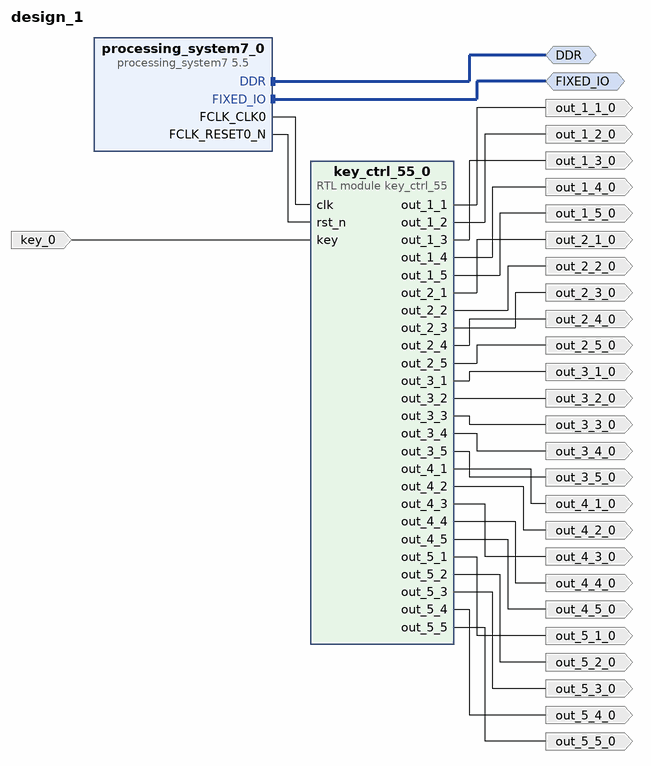
[diagram p0: block diagram of the top level]
# Vivado block design design_1, xc7z035ffg900-2, Vivado 2020.2
create_bd_design design_1

create_bd_intf_port -mode Master -vlnv xilinx.com:interface:ddrx_rtl:1.0 DDR
create_bd_intf_port -mode Master -vlnv xilinx.com:display_processing_system7:fixedio_rtl:1.0 FIXED_IO
create_bd_port -dir I key_0
create_bd_port -dir O out_1_1_0
create_bd_port -dir O out_1_2_0
create_bd_port -dir O out_1_3_0
create_bd_port -dir O out_1_4_0
create_bd_port -dir O out_1_5_0
create_bd_port -dir O out_2_1_0
create_bd_port -dir O out_2_2_0
create_bd_port -dir O out_2_3_0
create_bd_port -dir O out_2_4_0
create_bd_port -dir O out_2_5_0
create_bd_port -dir O out_3_1_0
create_bd_port -dir O out_3_2_0
create_bd_port -dir O out_3_3_0
create_bd_port -dir O out_3_4_0
create_bd_port -dir O out_3_5_0
create_bd_port -dir O out_4_1_0
create_bd_port -dir O out_4_2_0
create_bd_port -dir O out_4_3_0
create_bd_port -dir O out_4_4_0
create_bd_port -dir O out_4_5_0
create_bd_port -dir O out_5_1_0
create_bd_port -dir O out_5_2_0
create_bd_port -dir O out_5_3_0
create_bd_port -dir O out_5_4_0
create_bd_port -dir O out_5_5_0

create_bd_cell -type ip -vlnv xilinx.com:ip:processing_system7:5.5 processing_system7_0
set_property -dict [list \
  CONFIG.PCW_APU_PERIPHERAL_FREQMHZ 666.666666 \
  CONFIG.PCW_CPU_CPU_6X4X_MAX_RANGE 800 \
  CONFIG.PCW_ENET0_ENET0_IO {MIO 16 .. 27} \
  CONFIG.PCW_ENET0_GRP_MDIO_ENABLE 1 \
  CONFIG.PCW_ENET0_GRP_MDIO_IO {MIO 52 .. 53} \
  CONFIG.PCW_ENET0_PERIPHERAL_ENABLE 1 \
  CONFIG.PCW_FPGA0_PERIPHERAL_FREQMHZ 100 \
  CONFIG.PCW_FPGA1_PERIPHERAL_FREQMHZ 50 \
  CONFIG.PCW_GPIO_MIO_GPIO_ENABLE 0 \
  CONFIG.PCW_NAND_NAND_IO {MIO 0 2.. 14} \
  CONFIG.PCW_NAND_PERIPHERAL_ENABLE 1 \
  CONFIG.PCW_PERIPHERAL_BOARD_PRESET None \
  CONFIG.PCW_PRESET_BANK1_VOLTAGE {LVCMOS 1.8V} \
  CONFIG.PCW_SD0_PERIPHERAL_ENABLE 0 \
  CONFIG.PCW_UART0_PERIPHERAL_ENABLE 1 \
  CONFIG.PCW_UART0_UART0_IO {MIO 46 .. 47} \
  CONFIG.PCW_UART1_PERIPHERAL_ENABLE 0 \
  CONFIG.PCW_UART_PERIPHERAL_FREQMHZ 100 \
  CONFIG.PCW_UIPARAM_DDR_FREQ_MHZ 533.333333 \
  CONFIG.PCW_UIPARAM_DDR_MEMORY_TYPE {DDR 3 (Low Voltage)} \
  CONFIG.PCW_UIPARAM_DDR_PARTNO {MT41K256M16 RE-125} \
  CONFIG.PCW_USB0_PERIPHERAL_ENABLE 0 \
  CONFIG.PCW_USE_M_AXI_GP0 0 \
] [get_bd_cells processing_system7_0]
# 416 more settings of processing_system7_0 are not shown: defaults, MIO pin electricals, DDR timing, and values the tool derives
create_bd_cell -type module -reference key_ctrl_55 key_ctrl_55_0

# ---- connections ----

connect_bd_intf_net [get_bd_intf_ports DDR] [get_bd_intf_pins processing_system7_0/DDR]
connect_bd_intf_net [get_bd_intf_ports FIXED_IO] [get_bd_intf_pins processing_system7_0/FIXED_IO]
connect_bd_net [get_bd_pins processing_system7_0/FCLK_CLK0] [get_bd_pins key_ctrl_55_0/clk]
connect_bd_net -net key_0_1 [get_bd_ports key_0] [get_bd_pins key_ctrl_55_0/key]
connect_bd_net [get_bd_pins key_ctrl_55_0/out_1_1] [get_bd_ports out_1_1_0]
connect_bd_net [get_bd_pins key_ctrl_55_0/out_1_2] [get_bd_ports out_1_2_0]
connect_bd_net [get_bd_pins key_ctrl_55_0/out_1_3] [get_bd_ports out_1_3_0]
connect_bd_net [get_bd_pins key_ctrl_55_0/out_1_4] [get_bd_ports out_1_4_0]
connect_bd_net [get_bd_pins key_ctrl_55_0/out_1_5] [get_bd_ports out_1_5_0]
connect_bd_net [get_bd_pins key_ctrl_55_0/out_2_1] [get_bd_ports out_2_1_0]
connect_bd_net [get_bd_pins key_ctrl_55_0/out_2_2] [get_bd_ports out_2_2_0]
connect_bd_net [get_bd_pins key_ctrl_55_0/out_2_3] [get_bd_ports out_2_3_0]
connect_bd_net [get_bd_pins key_ctrl_55_0/out_2_4] [get_bd_ports out_2_4_0]
connect_bd_net [get_bd_pins key_ctrl_55_0/out_2_5] [get_bd_ports out_2_5_0]
connect_bd_net [get_bd_pins key_ctrl_55_0/out_3_1] [get_bd_ports out_3_1_0]
connect_bd_net [get_bd_pins key_ctrl_55_0/out_3_2] [get_bd_ports out_3_2_0]
connect_bd_net [get_bd_pins key_ctrl_55_0/out_3_3] [get_bd_ports out_3_3_0]
connect_bd_net [get_bd_pins key_ctrl_55_0/out_3_4] [get_bd_ports out_3_4_0]
connect_bd_net [get_bd_pins key_ctrl_55_0/out_3_5] [get_bd_ports out_3_5_0]
connect_bd_net [get_bd_pins key_ctrl_55_0/out_4_1] [get_bd_ports out_4_1_0]
connect_bd_net [get_bd_pins key_ctrl_55_0/out_4_2] [get_bd_ports out_4_2_0]
connect_bd_net [get_bd_pins key_ctrl_55_0/out_4_3] [get_bd_ports out_4_3_0]
connect_bd_net [get_bd_pins key_ctrl_55_0/out_4_4] [get_bd_ports out_4_4_0]
connect_bd_net [get_bd_pins key_ctrl_55_0/out_4_5] [get_bd_ports out_4_5_0]
connect_bd_net [get_bd_pins key_ctrl_55_0/out_5_1] [get_bd_ports out_5_1_0]
connect_bd_net [get_bd_pins key_ctrl_55_0/out_5_2] [get_bd_ports out_5_2_0]
connect_bd_net [get_bd_pins key_ctrl_55_0/out_5_3] [get_bd_ports out_5_3_0]
connect_bd_net [get_bd_pins key_ctrl_55_0/out_5_4] [get_bd_ports out_5_4_0]
connect_bd_net [get_bd_pins key_ctrl_55_0/out_5_5] [get_bd_ports out_5_5_0]
connect_bd_net [get_bd_pins processing_system7_0/FCLK_RESET0_N] [get_bd_pins key_ctrl_55_0/rst_n]

validate_bd_design
save_bd_design
